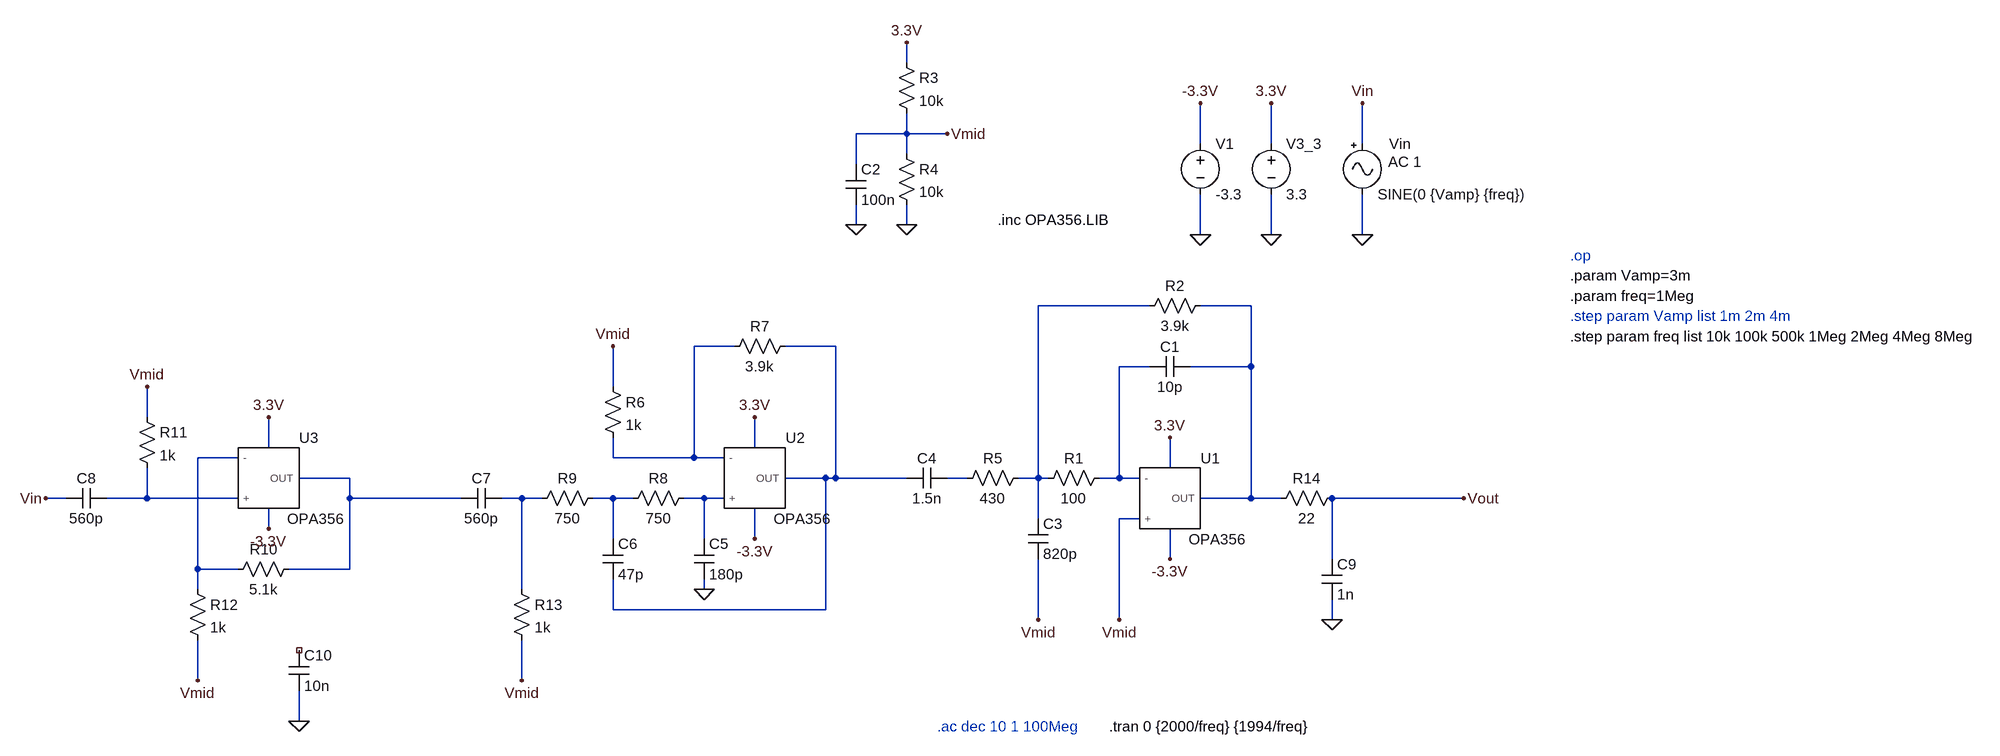
[diagram p0: schematic all_neg_v.asc]
all_neg_v.asc, the LTspice schematic file:
Version 4.1
SHEET 1 1548 864
WIRE -208 -256 -208 -288
WIRE -208 -144 -208 -176
WIRE -208 -144 -288 -144
WIRE -144 -144 -208 -144
WIRE 256 -128 256 -192
WIRE 368 -128 368 -192
WIRE 512 -128 512 -192
WIRE -208 -112 -208 -144
WIRE -288 -96 -288 -144
WIRE -288 0 -288 -32
WIRE -208 0 -208 -32
WIRE 256 16 256 -48
WIRE 368 16 368 -48
WIRE 512 16 512 -48
WIRE 176 128 0 128
WIRE 336 128 256 128
WIRE -480 192 -544 192
WIRE -320 192 -400 192
WIRE 176 224 128 224
WIRE 336 224 336 128
WIRE 336 224 240 224
WIRE -672 256 -672 192
WIRE -1408 304 -1408 256
WIRE -1216 352 -1216 304
WIRE -448 352 -448 304
WIRE -1264 368 -1328 368
WIRE -672 368 -672 336
WIRE -544 368 -544 192
WIRE -544 368 -672 368
WIRE -496 368 -544 368
WIRE 208 384 208 336
WIRE -1088 400 -1168 400
WIRE -336 400 -400 400
WIRE -320 400 -320 192
WIRE -320 400 -336 400
WIRE -208 400 -320 400
WIRE -112 400 -144 400
WIRE 0 400 0 128
WIRE 0 400 -32 400
WIRE 16 400 0 400
WIRE 128 400 128 224
WIRE 128 400 96 400
WIRE 160 400 128 400
WIRE -1536 432 -1568 432
WIRE -1408 432 -1408 384
WIRE -1408 432 -1472 432
WIRE -1264 432 -1408 432
WIRE -1088 432 -1088 400
WIRE -912 432 -1088 432
WIRE -816 432 -848 432
WIRE -784 432 -816 432
WIRE -672 432 -704 432
WIRE -640 432 -672 432
WIRE -528 432 -560 432
WIRE -496 432 -528 432
WIRE 336 432 336 224
WIRE 336 432 256 432
WIRE 384 432 336 432
WIRE 672 432 464 432
WIRE 0 464 0 400
WIRE 160 464 128 464
WIRE -1216 480 -1216 448
WIRE -672 496 -672 432
WIRE -528 496 -528 432
WIRE -448 496 -448 448
WIRE 208 528 208 480
WIRE 464 528 464 432
WIRE -1328 544 -1328 368
WIRE -1264 544 -1328 544
WIRE -1088 544 -1088 432
WIRE -1088 544 -1184 544
WIRE -1328 576 -1328 544
WIRE -816 576 -816 432
WIRE -528 576 -528 560
WIRE -672 608 -672 560
WIRE -336 608 -336 400
WIRE -336 608 -672 608
WIRE 0 624 0 528
WIRE 128 624 128 464
WIRE 464 624 464 592
WIRE -1328 720 -1328 656
WIRE -816 720 -816 656
WIRE -1168 784 -1168 736
FLAG 368 16 0
FLAG 512 16 0
FLAG 368 -192 3.3V
FLAG 512 -192 Vin
FLAG -208 -288 3.3V
FLAG -208 0 0
FLAG -288 0 0
FLAG -144 -144 Vmid
FLAG 208 336 3.3V
FLAG 672 432 Vout
FLAG -448 304 3.3V
FLAG -528 576 0
FLAG -672 192 Vmid
FLAG -1568 432 Vin
FLAG -1216 304 3.3V
FLAG 256 16 0
FLAG 256 -192 -3.3V
FLAG -1168 784 0
FLAG -448 496 -3.3V
FLAG 208 528 -3.3V
FLAG -1216 480 -3.3V
FLAG -1328 720 Vmid
FLAG -1408 256 Vmid
FLAG -816 720 Vmid
FLAG 0 624 Vmid
FLAG 464 624 0
FLAG 128 624 Vmid
SYMBOL voltage 368 -144 R0
WINDOW 123 0 0 Left 0
WINDOW 39 0 0 Left 0
SYMATTR InstName V3_3
SYMATTR Value 3.3
SYMBOL Misc\\signal 512 -144 R0
WINDOW 0 42 16 Left 2
WINDOW 123 41 44 Left 2
WINDOW 39 0 0 Left 0
SYMATTR InstName Vin
SYMATTR Value2 AC 1
SYMATTR Value SINE(0 {Vamp} {freq})
SYMBOL res -224 -272 R0
SYMATTR InstName R3
SYMATTR Value 10k
SYMBOL res -224 -128 R0
SYMATTR InstName R4
SYMATTR Value 10k
SYMBOL cap -304 -96 R0
SYMATTR InstName C2
SYMATTR Value 100n
SYMBOL OPA356 208 432 R0
SYMATTR InstName U1
SYMBOL res 272 112 R90
WINDOW 0 0 56 VBottom 2
WINDOW 3 32 56 VTop 2
SYMATTR InstName R2
SYMATTR Value 3.9k
SYMBOL cap 240 208 R90
WINDOW 0 0 32 VBottom 2
WINDOW 3 32 32 VTop 2
SYMATTR InstName C1
SYMATTR Value 10p
SYMBOL res 112 384 R90
WINDOW 0 0 56 VBottom 2
WINDOW 3 32 56 VTop 2
SYMATTR InstName R1
SYMATTR Value 100
SYMBOL cap -16 464 R0
SYMATTR InstName C3
SYMATTR Value 820p
SYMBOL cap -144 384 R90
WINDOW 0 0 32 VBottom 2
WINDOW 3 32 32 VTop 2
SYMATTR InstName C4
SYMATTR Value 1.5n
SYMBOL res -16 384 R90
WINDOW 0 0 56 VBottom 2
WINDOW 3 32 56 VTop 2
SYMATTR InstName R5
SYMATTR Value 430
SYMBOL OPA356 -448 400 R0
SYMATTR InstName U2
SYMBOL res -688 240 R0
SYMATTR InstName R6
SYMATTR Value 1k
SYMBOL res -384 176 R90
WINDOW 0 0 56 VBottom 2
WINDOW 3 32 56 VTop 2
SYMATTR InstName R7
SYMATTR Value 3.9k
SYMBOL res -544 416 R90
WINDOW 0 0 56 VBottom 2
WINDOW 3 32 56 VTop 2
SYMATTR InstName R8
SYMATTR Value 750
SYMBOL cap -544 496 R0
SYMATTR InstName C5
SYMATTR Value 180p
SYMBOL cap -688 496 R0
SYMATTR InstName C6
SYMATTR Value 47p
SYMBOL res -688 416 R90
WINDOW 0 0 56 VBottom 2
WINDOW 3 32 56 VTop 2
SYMATTR InstName R9
SYMATTR Value 750
SYMBOL cap -848 416 R90
WINDOW 0 0 32 VBottom 2
WINDOW 3 32 32 VTop 2
SYMATTR InstName C7
SYMATTR Value 560p
SYMBOL res -1168 528 R90
WINDOW 0 0 56 VBottom 2
WINDOW 3 32 56 VTop 2
SYMATTR InstName R10
SYMATTR Value 5.1k
SYMBOL cap -1472 416 R90
WINDOW 0 0 32 VBottom 2
WINDOW 3 32 32 VTop 2
SYMATTR InstName C8
SYMATTR Value 560p
SYMBOL res -1424 288 R0
SYMATTR InstName R11
SYMATTR Value 1k
SYMBOL res -1344 560 R0
SYMATTR InstName R12
SYMATTR Value 1k
SYMBOL cap -1184 672 R0
SYMATTR InstName C10
SYMATTR Value 10n
SYMBOL OPA356 -1216 400 R0
SYMATTR InstName U3
SYMBOL voltage 256 -144 R0
WINDOW 123 0 0 Left 0
WINDOW 39 0 0 Left 0
SYMATTR InstName V1
SYMATTR Value -3.3
SYMBOL res -832 560 R0
SYMATTR InstName R13
SYMATTR Value 1k
SYMBOL res 480 416 R90
WINDOW 0 0 56 VBottom 2
WINDOW 3 32 56 VTop 2
SYMATTR InstName R14
SYMATTR Value 22
SYMBOL cap 448 528 R0
SYMATTR InstName C9
SYMATTR Value 1n
TEXT -64 -8 Left 2 !.inc OPA356.LIB
TEXT 840 80 Left 2 !.param Vamp=3m
TEXT 840 112 Left 2 !.param freq=1Meg
TEXT 840 144 Left 2 ;.step param Vamp list 1m 2m 4m
TEXT 840 176 Left 2 !.step param freq list 10k 100k 500k 1Meg 2Meg 4Meg 8Meg
TEXT -160 792 Left 2 ;.ac dec 10 1 100Meg
TEXT 112 792 Left 2 !.tran 0 {2000/freq} {1994/freq}
TEXT 840 48 Left 2 ;.op

The netlist it stands for:
* all_neg_v.asc
V3_3 3.3V 0 3.3
Vin Vin 0 SINE(0 {Vamp} {freq}) AC 1
R3 3.3V Vmid 10k
R4 Vmid 0 10k
C2 Vmid 0 100n
X§U1 N002 -3.3V Vmid N005 3.3V OPA356  ; pins OUT -V + - +V
R2 N002 N001 3.9k
C1 N002 N005 10p
R1 N005 N001 100
C3 N001 Vmid 820p
C4 N008 N004 1.5n
R5 N001 N008 430
X§U2 N004 -3.3V N012 N003 3.3V OPA356  ; pins OUT -V + - +V
R6 Vmid N003 1k
R7 N004 N003 3.9k
R8 N012 N011 750
C5 N012 0 180p
C6 N011 N004 47p
R9 N011 N010 750
C7 N010 N007 560p
R10 N007 N006 5.1k
C8 N009 Vin 560p
R11 Vmid N009 1k
R12 N006 Vmid 1k
C10 NC_01 0 10n
X§U3 N007 -3.3V N009 N006 3.3V OPA356  ; pins OUT -V + - +V
V1 -3.3V 0 -3.3
R13 N010 Vmid 1k
R14 Vout N002 22
C9 Vout 0 1n
.inc OPA356.LIB
.param Vamp=3m
.param freq=1Meg
* .step param Vamp list 1m 2m 4m
.step param freq list 10k 100k 500k 1Meg 2Meg 4Meg 8Meg
* .ac dec 10 1 100Meg
.tran 0 {2000/freq} {1994/freq}
* .op
.lib OPA356.LIB
.backanno
.end